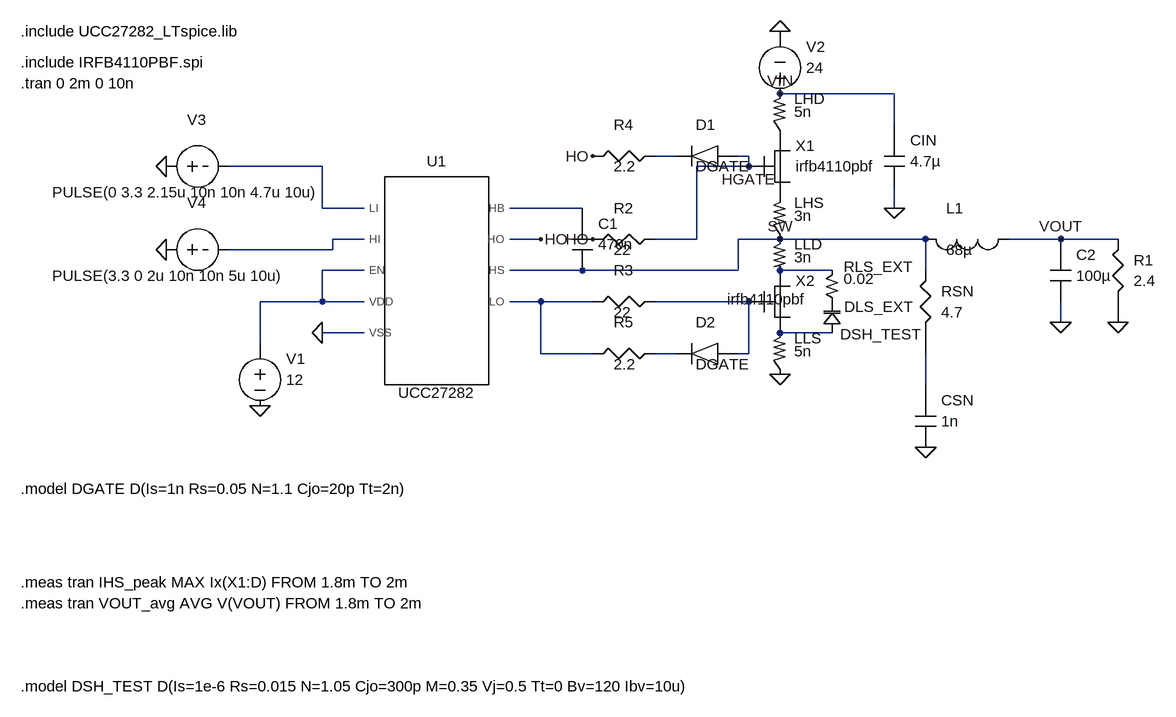
[diagram p0: schematic IRFB4110_Parasitics_Snubber_Diode_R_LOW.asc.asc]
IRFB4110_Parasitics_Snubber_Diode_R_LOW.asc.asc, the LTspice schematic file:
Version 4.1
SHEET 1 2048 1328
WIRE 1408 128 1232 128
WIRE 1408 176 1408 128
WIRE 1072 224 1040 224
WIRE 1184 224 1168 224
WIRE 528 240 384 240
WIRE 1184 240 1184 224
WIRE 1184 240 1104 240
WIRE 528 304 528 240
WIRE 592 304 528 304
WIRE 928 304 816 304
WIRE 1408 304 1408 272
WIRE 592 352 544 352
WIRE 864 352 816 352
WIRE 1104 352 1104 240
WIRE 1104 352 1040 352
WIRE 1232 352 1168 352
WIRE 1456 352 1232 352
WIRE 1664 352 1584 352
WIRE 1752 352 1664 352
WIRE 544 368 544 352
WIRE 544 368 384 368
WIRE 592 400 528 400
WIRE 928 400 816 400
WIRE 1168 400 1168 352
WIRE 1168 400 928 400
WIRE 1312 400 1232 400
WIRE 1456 400 1456 352
WIRE 528 448 528 400
WIRE 528 448 432 448
WIRE 592 448 528 448
WIRE 864 448 816 448
WIRE 944 448 864 448
WIRE 1184 448 1040 448
WIRE 1664 480 1664 448
WIRE 592 496 528 496
WIRE 1312 496 1232 496
WIRE 432 512 432 448
WIRE 864 528 864 448
WIRE 944 528 864 528
WIRE 1072 528 1040 528
WIRE 1184 528 1184 448
WIRE 1184 528 1168 528
WIRE 1456 576 1456 528
FLAG 944 224 HO
FLAG 288 240 0
FLAG 288 368 0
FLAG 432 608 0
FLAG 528 496 0
FLAG 1232 32 0
FLAG 1664 480 0
FLAG 1752 480 0
FLAG 864 352 HO
FLAG 944 352 HO
FLAG 1232 352 SW
FLAG 1664 352 VOUT
FLAG 1232 128 VIN
FLAG 1232 560 0
FLAG 1408 304 0
FLAG 1184 240 HGATE
FLAG 1456 672 0
SYMBOL Buck_Vpulse_H 288 192 R0
SYMATTR InstName V3
SYMATTR Value PULSE(0 3.3 2.15u 10n 10n 4.7u 10u)
SYMBOL Buck_Vpulse_H 288 320 R0
SYMATTR InstName V4
SYMATTR Value PULSE(3.3 0 2u 10n 10n 5u 10u)
SYMBOL UCC27282 624 256 R0
SYMATTR InstName U1
SYMBOL Buck_Vsrc 416 512 R0
SYMATTR InstName V1
SYMBOL Buck_Vsrc_Inv 1216 32 R0
SYMATTR InstName V2
SYMBOL Buck_Cap_V 912 304 R0
SYMATTR InstName C1
SYMBOL Buck_Res_H 944 336 R0
SYMATTR InstName R2
SYMATTR Value 22
SYMBOL Buck_Res_H 944 432 R0
SYMATTR InstName R3
SYMATTR Value 22
SYMBOL Buck_Res_H 944 208 R0
SYMATTR InstName R4
SYMATTR Value 2.2
SYMBOL Buck_Diode_H 1072 208 R0
SYMATTR InstName D1
SYMBOL Buck_Res_H 944 512 R0
SYMATTR InstName R5
SYMATTR Value 2.2
SYMBOL Buck_Diode_H 1072 512 R0
SYMATTR InstName D2
SYMBOL Buck_NMOS_Subckt 1184 192 R0
SYMATTR InstName X1
SYMBOL Buck_NMOS_Subckt 1184 400 R0
WINDOW 3 -33 44 Left 2
SYMATTR InstName X2
SYMBOL Buck_Ind_H 1456 336 R0
SYMATTR InstName L1
SYMATTR Value 68µ
SYMBOL Buck_Cap_V 1648 352 R0
SYMATTR InstName C2
SYMATTR Value 100µ
SYMBOL Buck_Res_V 1736 352 R0
SYMATTR InstName R1
SYMBOL Buck_Ind_V64 1216 128 R0
SYMATTR InstName LHD
SYMBOL Buck_Ind_V64 1216 288 R0
SYMATTR InstName LHS
SYMATTR Value 3n
SYMBOL Buck_Ind_V48 1216 352 R0
SYMATTR InstName LLD
SYMATTR Value 3n
SYMBOL Buck_Ind_V64 1216 496 R0
SYMATTR InstName LLS
SYMBOL Buck_Cap_V 1392 176 R0
SYMATTR InstName CIN
SYMATTR Value 4.7µ
SYMATTR SpiceLine Rser=20m Lser=1n
SYMBOL Buck_Res_V 1440 400 R0
SYMATTR InstName RSN
SYMATTR Value 4.7
SYMBOL Buck_Cap_V 1440 576 R0
SYMATTR InstName CSN
SYMATTR Value 1n
SYMBOL Buck_Res_V48 1296 400 R0
SYMATTR InstName RLS_EXT
SYMBOL Buck_Diode_V48 1296 448 R0
WINDOW 0 35 8 Left 2
WINDOW 3 29 50 Left 2
SYMATTR InstName DLS_EXT
TEXT 64 32 Left 2 !.include UCC27282_LTspice.lib
TEXT 64 80 Left 2 !.include IRFB4110PBF.spi
TEXT 64 112 Left 2 !.tran 0 2m 0 10n
TEXT 64 736 Left 2 !.model DGATE D(Is=1n Rs=0.05 N=1.1 Cjo=20p Tt=2n)
TEXT 64 880 Left 2 !.meas tran IHS_peak MAX Ix(X1:D) FROM 1.8m TO 2m
TEXT 64 912 Left 2 !.meas tran VOUT_avg AVG V(VOUT) FROM 1.8m TO 2m
TEXT 64 1040 Left 2 !.model DSH_TEST D(Is=1e-6 Rs=0.015 N=1.05 Cjo=300p M=0.35 Vj=0.5 Tt=0 Bv=120 Ibv=10u)

The netlist it stands for:
* IRFB4110_Parasitics_Snubber_Diode_R_LOW.asc.asc
V3 N002 0 PULSE(0 3.3 2.15u 10n 10n 4.7u 10u)
V4 N004 0 PULSE(3.3 0 2u 10n 10n 5u 10u)
X§U1 N002 N004 N005 N005 0 N003 HO SW N007 UCC27282  ; pins LI HI EN VDD VSS HB HO HS LO
V1 N005 0 12
V2 VIN 0 24
C1 N003 SW 470n
R2 HO HGATE 22
R3 N007 N008 22
R4 HO N001 2.2
D1 HGATE N001 DGATE
R5 N007 N010 2.2
D2 N008 N010 DGATE
X§X1 P001 HGATE P002 irfb4110pbf  ; pins D G S
X§X2 N006 N008 N009 irfb4110pbf  ; pins D G S
L1 SW VOUT 68µ
C2 VOUT 0 100µ
R1 VOUT 0 2.4
LHD VIN P001 5n
LHS P002 SW 3n
LLD SW N006 3n
LLS N009 0 5n
CIN VIN 0 4.7µ Rser=20m Lser=1n
RSN SW N011 4.7
CSN N011 0 1n
RLS_EXT N006 P003 0.02
DLS_EXT N009 P003 DSH_TEST
.model D D
.lib standard.dio
.include UCC27282_LTspice.lib
.include IRFB4110PBF.spi
.tran 0 2m 0 10n
.model DGATE D(Is=1n Rs=0.05 N=1.1 Cjo=20p Tt=2n)
.meas tran IHS_peak MAX Ix(X1:D) FROM 1.8m TO 2m
.meas tran VOUT_avg AVG V(VOUT) FROM 1.8m TO 2m
.model DSH_TEST D(Is=1e-6 Rs=0.015 N=1.05 Cjo=300p M=0.35 Vj=0.5 Tt=0 Bv=120 Ibv=10u)
.backanno
.end